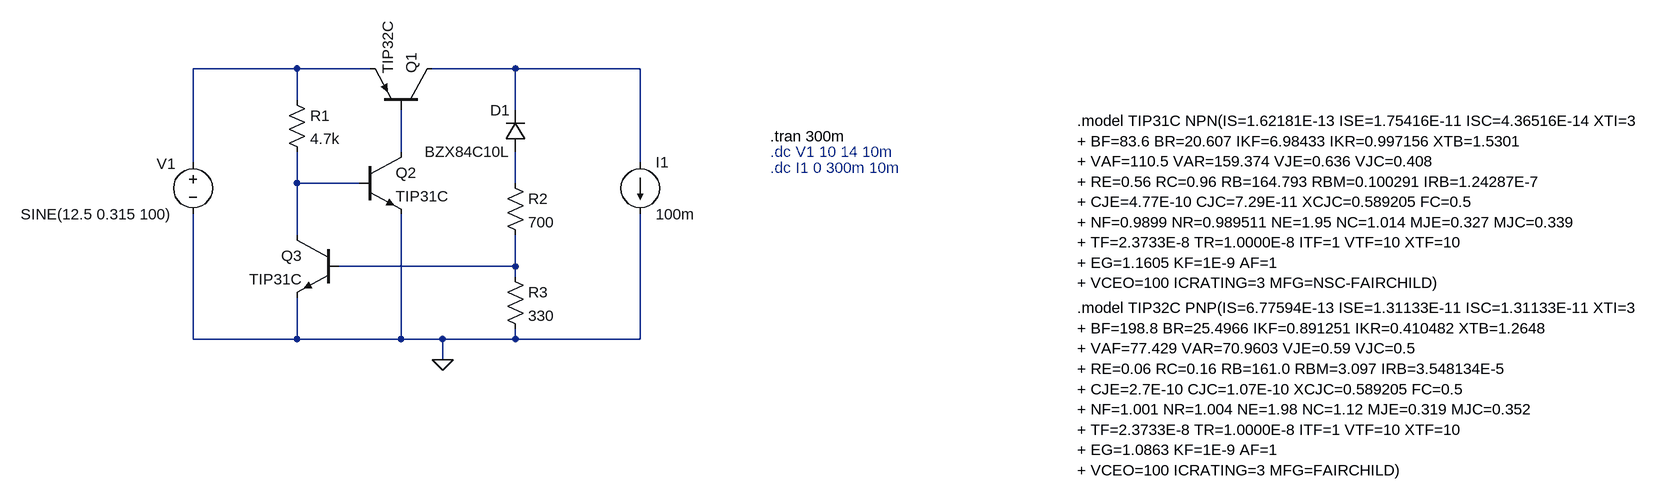
[diagram p0: schematic Stabilizator_liniar.asc]
Stabilizator_liniar.asc, the LTspice schematic file:
Version 4.1
SHEET 1 2268 2212
WIRE 128 400 -32 400
WIRE 240 400 128 400
WIRE 464 400 336 400
WIRE 656 400 464 400
WIRE 128 448 128 400
WIRE 464 464 464 400
WIRE 288 528 288 464
WIRE -32 544 -32 400
WIRE 656 544 656 400
WIRE 128 576 128 528
WIRE 224 576 128 576
WIRE 464 576 464 528
WIRE 128 656 128 576
WIRE 464 704 464 656
WIRE 464 704 192 704
WIRE 464 720 464 704
WIRE -32 816 -32 624
WIRE 128 816 128 752
WIRE 128 816 -32 816
WIRE 288 816 288 624
WIRE 288 816 128 816
WIRE 352 816 288 816
WIRE 464 816 464 800
WIRE 464 816 352 816
WIRE 656 816 656 624
WIRE 656 816 464 816
WIRE 352 848 352 816
FLAG 352 848 0
SYMBOL voltage -32 528 R0
WINDOW 0 -56 18 Left 2
WINDOW 3 -265 96 Left 2
WINDOW 123 0 0 Left 0
WINDOW 39 0 0 Left 0
SYMATTR InstName V1
SYMATTR Value SINE(12.5 0.315 100)
SYMBOL pnp 336 464 M270
SYMATTR InstName Q1
SYMATTR Value TIP32C
SYMBOL npn 224 528 R0
SYMATTR InstName Q2
SYMATTR Value TIP31C
SYMBOL npn 192 656 M0
SYMATTR InstName Q3
SYMATTR Value TIP31C
SYMBOL res 112 432 R0
SYMATTR InstName R1
SYMATTR Value 4.7k
SYMBOL current 656 544 R0
SYMATTR InstName I1
SYMATTR Value 100m
SYMBOL diode 480 528 R180
WINDOW 0 24 64 Left 2
WINDOW 3 24 0 Left 2
SYMATTR InstName D1
SYMATTR Value BZX84C10L
SYMBOL res 448 560 R0
SYMATTR InstName R2
SYMATTR Value 700
SYMBOL res 448 704 R0
SYMATTR InstName R3
SYMATTR Value 330
TEXT 1328 480 Left 2 !.model TIP31C NPN(IS=1.62181E-13 ISE=1.75416E-11 ISC=4.36516E-14 XTI=3\n+ BF=83.6 BR=20.607 IKF=6.98433 IKR=0.997156 XTB=1.5301\n+ VAF=110.5 VAR=159.374 VJE=0.636 VJC=0.408\n+ RE=0.56 RC=0.96 RB=164.793 RBM=0.100291 IRB=1.24287E-7\n+ CJE=4.77E-10 CJC=7.29E-11 XCJC=0.589205 FC=0.5\n+ NF=0.9899 NR=0.989511 NE=1.95 NC=1.014 MJE=0.327 MJC=0.339\n+ TF=2.3733E-8 TR=1.0000E-8 ITF=1 VTF=10 XTF=10\n+ EG=1.1605 KF=1E-9 AF=1\n+ VCEO=100 ICRATING=3 MFG=NSC-FAIRCHILD)
TEXT 1328 768 Left 2 !.model TIP32C PNP(IS=6.77594E-13 ISE=1.31133E-11 ISC=1.31133E-11 XTI=3\n+ BF=198.8 BR=25.4966 IKF=0.891251 IKR=0.410482 XTB=1.2648\n+ VAF=77.429 VAR=70.9603 VJE=0.59 VJC=0.5\n+ RE=0.06 RC=0.16 RB=161.0 RBM=3.097 IRB=3.548134E-5\n+ CJE=2.7E-10 CJC=1.07E-10 XCJC=0.589205 FC=0.5\n+ NF=1.001 NR=1.004 NE=1.98 NC=1.12 MJE=0.319 MJC=0.352\n+ TF=2.3733E-8 TR=1.0000E-8 ITF=1 VTF=10 XTF=10\n+ EG=1.0863 KF=1E-9 AF=1\n+ VCEO=100 ICRATING=3 MFG=FAIRCHILD)
TEXT 856 504 Left 2 !.tran 300m
TEXT 856 528 Left 2 ;.dc V1 10 14 10m
TEXT 856 552 Left 2 ;.dc I1 0 300m 10m

The netlist it stands for:
* Stabilizator_liniar.asc
V1 N001 0 SINE(12.5 0.315 100)
Q1 N002 N003 N001 0 TIP32C
Q2 N003 N004 0 0 TIP31C
Q3 N004 N006 0 0 TIP31C
R1 N001 N004 4.7k
I1 N002 0 100m
D1 N005 N002 BZX84C10L
R2 N005 N006 700
R3 N006 0 330
.model D D
.lib standard.dio
.model NPN NPN
.model PNP PNP
.lib standard.bjt
.model TIP31C NPN(IS=1.62181E-13 ISE=1.75416E-11 ISC=4.36516E-14 XTI=3
+ BF=83.6 BR=20.607 IKF=6.98433 IKR=0.997156 XTB=1.5301
+ VAF=110.5 VAR=159.374 VJE=0.636 VJC=0.408
+ RE=0.56 RC=0.96 RB=164.793 RBM=0.100291 IRB=1.24287E-7
+ CJE=4.77E-10 CJC=7.29E-11 XCJC=0.589205 FC=0.5
+ NF=0.9899 NR=0.989511 NE=1.95 NC=1.014 MJE=0.327 MJC=0.339
+ TF=2.3733E-8 TR=1.0000E-8 ITF=1 VTF=10 XTF=10
+ EG=1.1605 KF=1E-9 AF=1
+ VCEO=100 ICRATING=3 MFG=NSC-FAIRCHILD)
.model TIP32C PNP(IS=6.77594E-13 ISE=1.31133E-11 ISC=1.31133E-11 XTI=3
+ BF=198.8 BR=25.4966 IKF=0.891251 IKR=0.410482 XTB=1.2648
+ VAF=77.429 VAR=70.9603 VJE=0.59 VJC=0.5
+ RE=0.06 RC=0.16 RB=161.0 RBM=3.097 IRB=3.548134E-5
+ CJE=2.7E-10 CJC=1.07E-10 XCJC=0.589205 FC=0.5
+ NF=1.001 NR=1.004 NE=1.98 NC=1.12 MJE=0.319 MJC=0.352
+ TF=2.3733E-8 TR=1.0000E-8 ITF=1 VTF=10 XTF=10
+ EG=1.0863 KF=1E-9 AF=1
+ VCEO=100 ICRATING=3 MFG=FAIRCHILD)
.tran 300m
* .dc V1 10 14 10m
* .dc I1 0 300m 10m
.backanno
.end